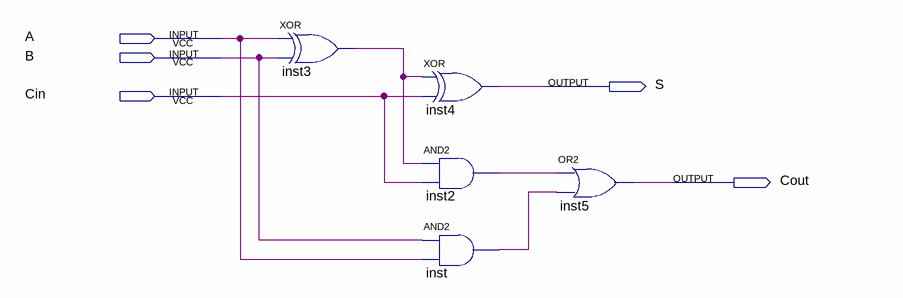
[diagram p0: schematic sheet]
// Quartus schematic full_adder.bdf as structural Verilog: 5 symbols, 5 pins
module full_adder (
  input  A,
  input  B,
  input  Cin,
  output S,
  output Cout
);

  wire inst2_out, inst3_out, inst_out;

  xor inst3 (inst3_out, A, B);
  xor inst4 (S, inst3_out, Cin);
  and inst2 (inst2_out, inst3_out, Cin);
  and inst (inst_out, B, A);
  or inst5 (Cout, inst2_out, inst_out);
endmodule
